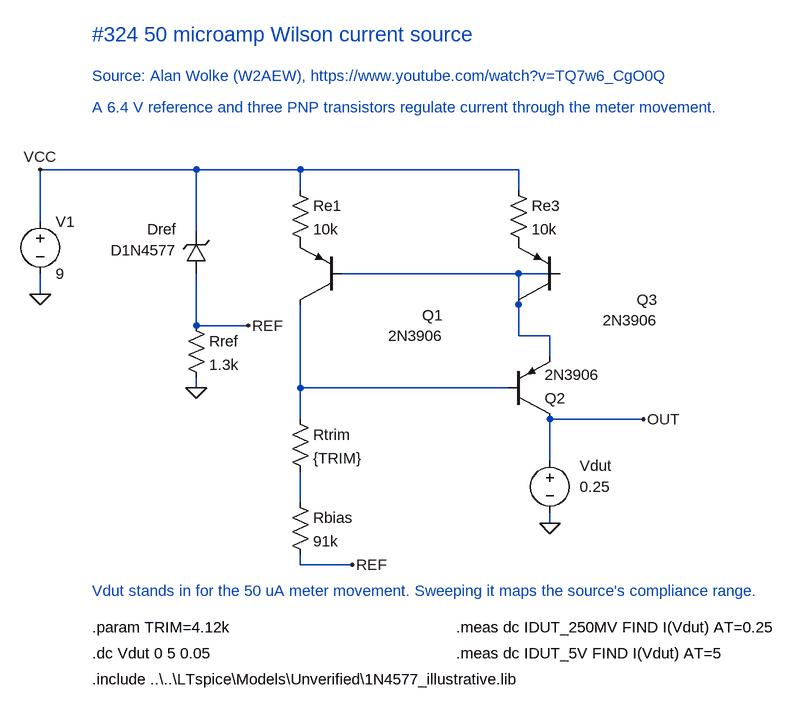
[diagram p0: schematic 50 microamp Wilson current source.asc]
50 microamp Wilson current source.asc, the LTspice schematic file:
Version 4.1
SHEET 1 1200 1120
WIRE 240 256 0 256
WIRE 400 256 240 256
WIRE 736 256 400 256
WIRE 0 336 0 256
WIRE 240 352 240 256
WIRE 400 288 400 256
WIRE 736 288 736 256
WIRE 240 416 240 432
WIRE 240 496 240 432
WIRE 320 496 240 496
WIRE 0 432 0 416
WIRE 0 448 0 432
WIRE 464 416 800 416
WIRE 736 416 736 464
WIRE 736 464 736 512
WIRE 784 512 736 512
WIRE 784 544 784 512
WIRE 400 464 400 592
WIRE 720 592 400 592
WIRE 400 640 400 592
WIRE 400 768 400 720
WIRE 784 704 784 640
WIRE 928 640 784 640
WIRE 784 784 784 800
WIRE 400 848 400 864
WIRE 480 864 400 864
WIRE 240 576 240 592
FLAG 0 448 0
FLAG 240 592 0
FLAG 320 496 REF
FLAG 480 864 REF
FLAG 784 800 0
FLAG 928 640 OUT
FLAG 0 256 VCC
SYMBOL voltage 0 320 R0
SYMATTR InstName V1
SYMATTR Value 9
SYMBOL zener 256 416 R180
WINDOW 0 46 68 Left 2
WINDOW 3 46 36 Left 2
SYMATTR InstName Dref
SYMATTR Value D1N4577
SYMBOL res 224 480 R0
SYMATTR InstName Rref
SYMATTR Value 1.3k
SYMBOL res 384 272 R0
SYMATTR InstName Re1
SYMATTR Value 10k
SYMBOL res 720 272 R0
SYMATTR InstName Re3
SYMATTR Value 10k
SYMBOL pnp 464 464 R180
WINDOW 0 -156 -16 Left 2
WINDOW 3 -156 -48 Left 2
SYMATTR InstName Q1
SYMATTR Value 2N3906
SYMBOL pnp 800 464 R180
WINDOW 0 -150 8 Left 2
WINDOW 3 -150 -24 Left 2
SYMATTR InstName Q3
SYMATTR Value 2N3906
SYMBOL pnp 720 640 M180
SYMATTR InstName Q2
SYMATTR Value 2N3906
SYMBOL res 384 624 R0
SYMATTR InstName Rtrim
SYMATTR Value {TRIM}
SYMBOL res 384 752 R0
SYMATTR InstName Rbias
SYMATTR Value 91k
SYMBOL voltage 784 688 R0
WINDOW 0 46 24 Left 2
WINDOW 3 46 56 Left 2
SYMATTR InstName Vdut
SYMATTR Value 0.25
TEXT 80 48 Left 3 ;#324 50 microamp Wilson current source
TEXT 80 112 Left 2 ;Source: Alan Wolke (W2AEW), https://www.youtube.com/watch?v=TQ7w6_CgO0Q
TEXT 80 160 Left 2 ;A 6.4 V reference and three PNP transistors regulate current through the meter movement.
TEXT 80 904 Left 2 ;Vdut stands in for the 50 uA meter movement. Sweeping it maps the source's compliance range.
TEXT 80 960 Left 2 !.param TRIM=4.12k
TEXT 80 1000 Left 2 !.dc Vdut 0 5 0.05
TEXT 640 960 Left 2 !.meas dc IDUT_250MV FIND I(Vdut) AT=0.25
TEXT 640 1000 Left 2 !.meas dc IDUT_5V FIND I(Vdut) AT=5
TEXT 80 1040 Left 2 !.include ..\..\LTspice\Models\Unverified\1N4577_illustrative.lib

The netlist it stands for:
* 50 microamp Wilson current source.asc
V1 VCC 0 9
Dref REF VCC D1N4577
Rref REF 0 1.3k
Re1 VCC P001 10k
Re3 VCC P002 10k
Q1 N002 N001 P001 0 2N3906
Q3 N001 N001 P002 0 2N3906
Q2 OUT N002 N001 0 2N3906
Rtrim N002 N003 {TRIM}
Rbias N003 REF 91k
Vdut OUT 0 0.25
.model D D
.lib standard.dio
.model NPN NPN
.model PNP PNP
.lib standard.bjt
* #324 50 microamp Wilson current source
* Source: Alan Wolke (W2AEW), https://www.youtube.com/watch?v=TQ7w6_CgO0Q
* A 6.4 V reference and three PNP transistors regulate current through the meter movement.
* Vdut stands in for the 50 uA meter movement. Sweeping it maps the source's compliance range.
.param TRIM=4.12k
.dc Vdut 0 5 0.05
.meas dc IDUT_250MV FIND I(Vdut) AT=0.25
.meas dc IDUT_5V FIND I(Vdut) AT=5
.include ..\..\LTspice\Models\Unverified\1N4577_illustrative.lib
.backanno
.end